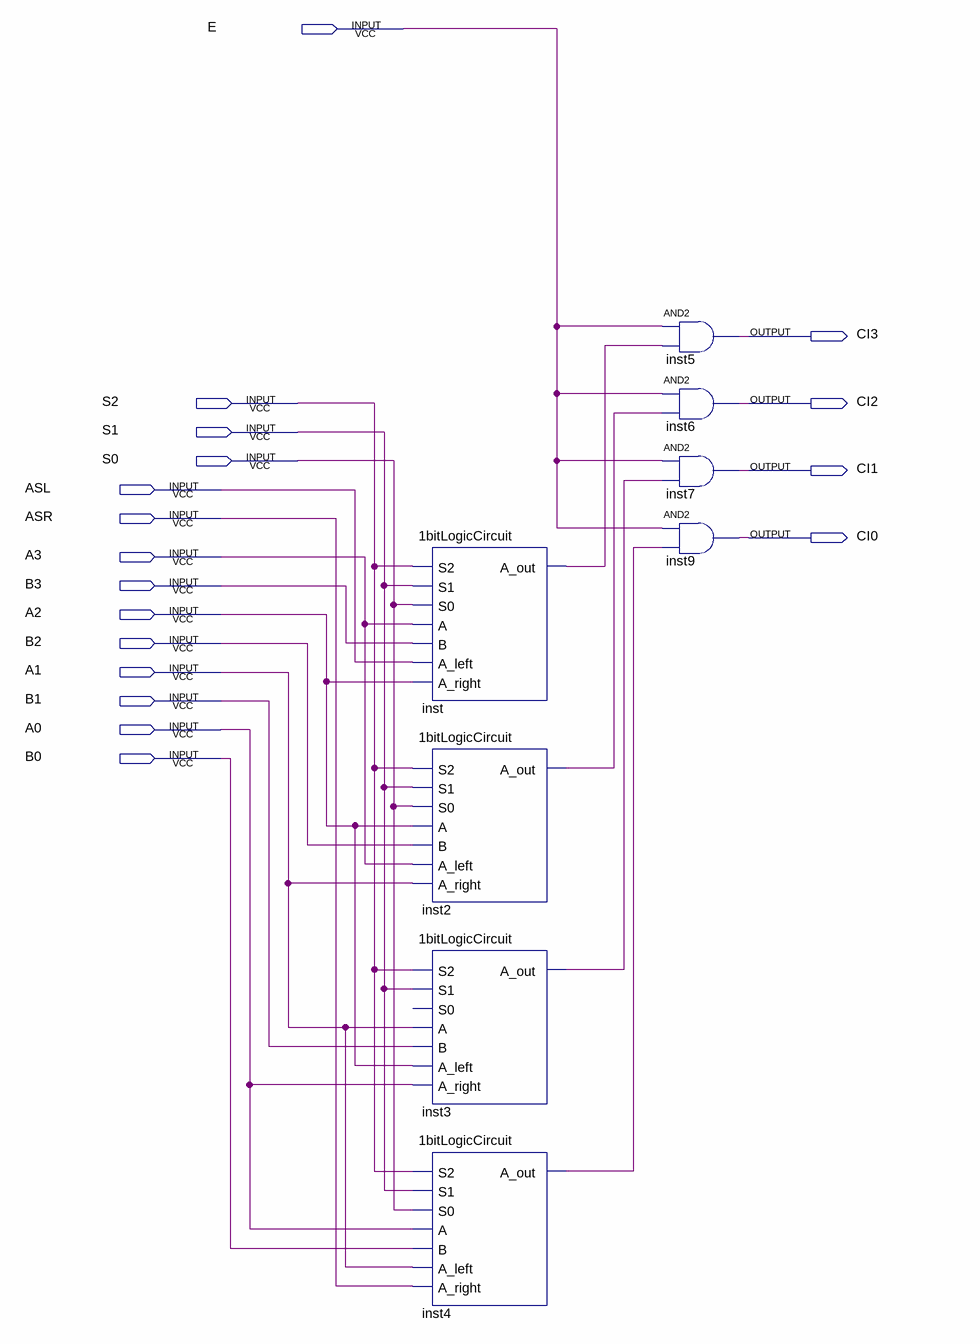
[diagram p0: schematic sheet]
// Quartus schematic 4bitLogicCircuit.bdf as structural Verilog: 8 symbols, 18 pins
module \4bitLogicCircuit  (
  input  E,
  input  S2,
  input  S1,
  input  S0,
  input  ASL,
  input  ASR,
  input  A3,
  input  B3,
  input  A2,
  input  B2,
  input  A1,
  input  B1,
  input  A0,
  input  B0,
  output CI3,
  output CI2,
  output CI1,
  output CI0
);

  wire inst2_a_out, inst3_a_out, inst4_a_out, inst_a_out;

  \1bitLogicCircuit  inst (.S2(S2), .S1(S1), .S0(S0), .A(A3), .B(B3), .A_left(ASL), .A_right(A2), .A_out(inst_a_out));
  \1bitLogicCircuit  inst2 (.S2(S2), .S1(S1), .S0(S0), .A(A2), .B(B2), .A_left(A3), .A_right(A1), .A_out(inst2_a_out));
  \1bitLogicCircuit  inst3 (
    .S2(S2), .S1(S1), .A(A1), .B(B1), .A_left(A2), .A_right(A0), .A_out(inst3_a_out));  // open: S0
  \1bitLogicCircuit  inst4 (.S2(S2), .S1(S1), .S0(S0), .A(A0), .B(B0), .A_left(A1), .A_right(ASR), .A_out(inst4_a_out));
  and inst5 (CI3, E, inst_a_out);
  and inst6 (CI2, E, inst2_a_out);
  and inst7 (CI1, E, inst3_a_out);
  and inst9 (CI0, E, inst4_a_out);
endmodule
